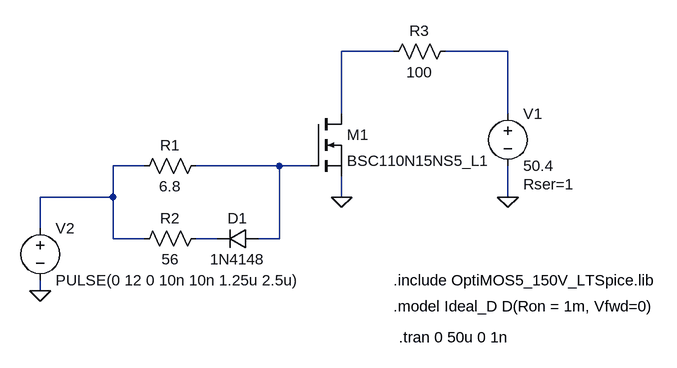
[diagram p0: schematic gate_res_diode.asc]
gate_res_diode.asc, the LTspice schematic file:
Version 4.1
SHEET 1 880 680
WIRE 144 -64 64 -64
WIRE 320 -64 224 -64
WIRE 64 32 64 -64
WIRE 320 32 320 -64
WIRE -240 112 -288 112
WIRE -32 112 -160 112
WIRE 16 112 -32 112
WIRE -288 160 -288 112
WIRE -288 160 -400 160
WIRE 64 160 64 128
WIRE 320 160 320 112
WIRE -400 208 -400 160
WIRE -288 224 -288 160
WIRE -240 224 -288 224
WIRE -128 224 -160 224
WIRE -32 224 -32 112
WIRE -32 224 -64 224
WIRE -400 304 -400 288
FLAG 64 160 0
FLAG -400 304 0
FLAG 320 160 0
SYMBOL nmos 16 32 R0
SYMATTR InstName M1
SYMATTR Value BSC110N15NS5_L1
SYMATTR Prefix X
SYMBOL res -144 96 R90
WINDOW 0 0 56 VBottom 2
WINDOW 3 32 56 VTop 2
SYMATTR InstName R1
SYMATTR Value 6.8
SYMBOL res -144 208 R90
WINDOW 0 0 56 VBottom 2
WINDOW 3 32 56 VTop 2
SYMATTR InstName R2
SYMATTR Value 56
SYMBOL diode -64 208 R90
WINDOW 0 0 32 VBottom 2
WINDOW 3 32 32 VTop 2
SYMATTR InstName D1
SYMATTR Value 1N4148
SYMBOL voltage 320 16 R0
WINDOW 123 0 0 Left 0
WINDOW 39 24 124 Left 2
SYMATTR InstName V1
SYMATTR Value 50.4
SYMATTR SpiceLine Rser=1
SYMBOL res 240 -80 R90
WINDOW 0 0 56 VBottom 2
WINDOW 3 32 56 VTop 2
SYMATTR InstName R3
SYMATTR Value 100
SYMBOL voltage -400 192 R0
WINDOW 123 0 0 Left 0
WINDOW 39 0 0 Left 0
SYMATTR InstName V2
SYMATTR Value PULSE(0 12 0 10n 10n 1.25u 2.5u)
TEXT 144 288 Left 2 !.include OptiMOS5_150V_LTSpice.lib
TEXT 144 328 Left 2 !.model Ideal_D D(Ron = 1m, Vfwd=0)
TEXT 152 376 Left 2 !.tran 0 50u 0 1n

The netlist it stands for:
* gate_res_diode.asc
X§M1 N001 N004 0 BSC110N15NS5_L1  ; pins D G S
R1 N004 N003 6.8
R2 N005 N003 56
D1 N004 N005 1N4148
V1 N002 0 50.4 Rser=1
R3 N002 N001 100
V2 N003 0 PULSE(0 12 0 10n 10n 1.25u 2.5u)
.model D D
.lib standard.dio
.include OptiMOS5_150V_LTSpice.lib
.model Ideal_D D(Ron = 1m, Vfwd=0)
.tran 0 50u 0 1n
.backanno
.end